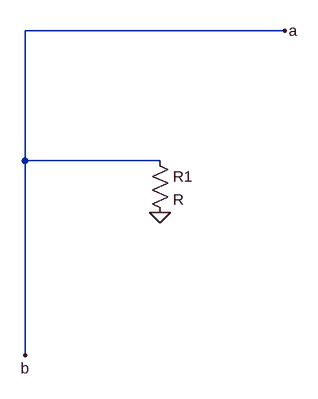
[diagram p0: schematic etiquetas-varias-mayor-y.asc]
etiquetas-varias-mayor-y.asc, the LTspice schematic file:
Version 4
SHEET 1 880 680
WIRE 0 -200 0 0
WIRE 0 0 208 0
WIRE 0 -200 400 -200
WIRE 0 300 0 0
FLAG 400 -200 a
FLAG 0 300 b
FLAG 208 80 0
SYMBOL res 192 -16 R0
SYMATTR InstName R1

The netlist it stands for:
* etiquetas-varias-mayor-y.asc
R1 b 0 R
.backanno
.end